# Altium schematic sheet POWERSWITCH.SchDoc
size A; SheetNumber: 4; SheetTotal: 4
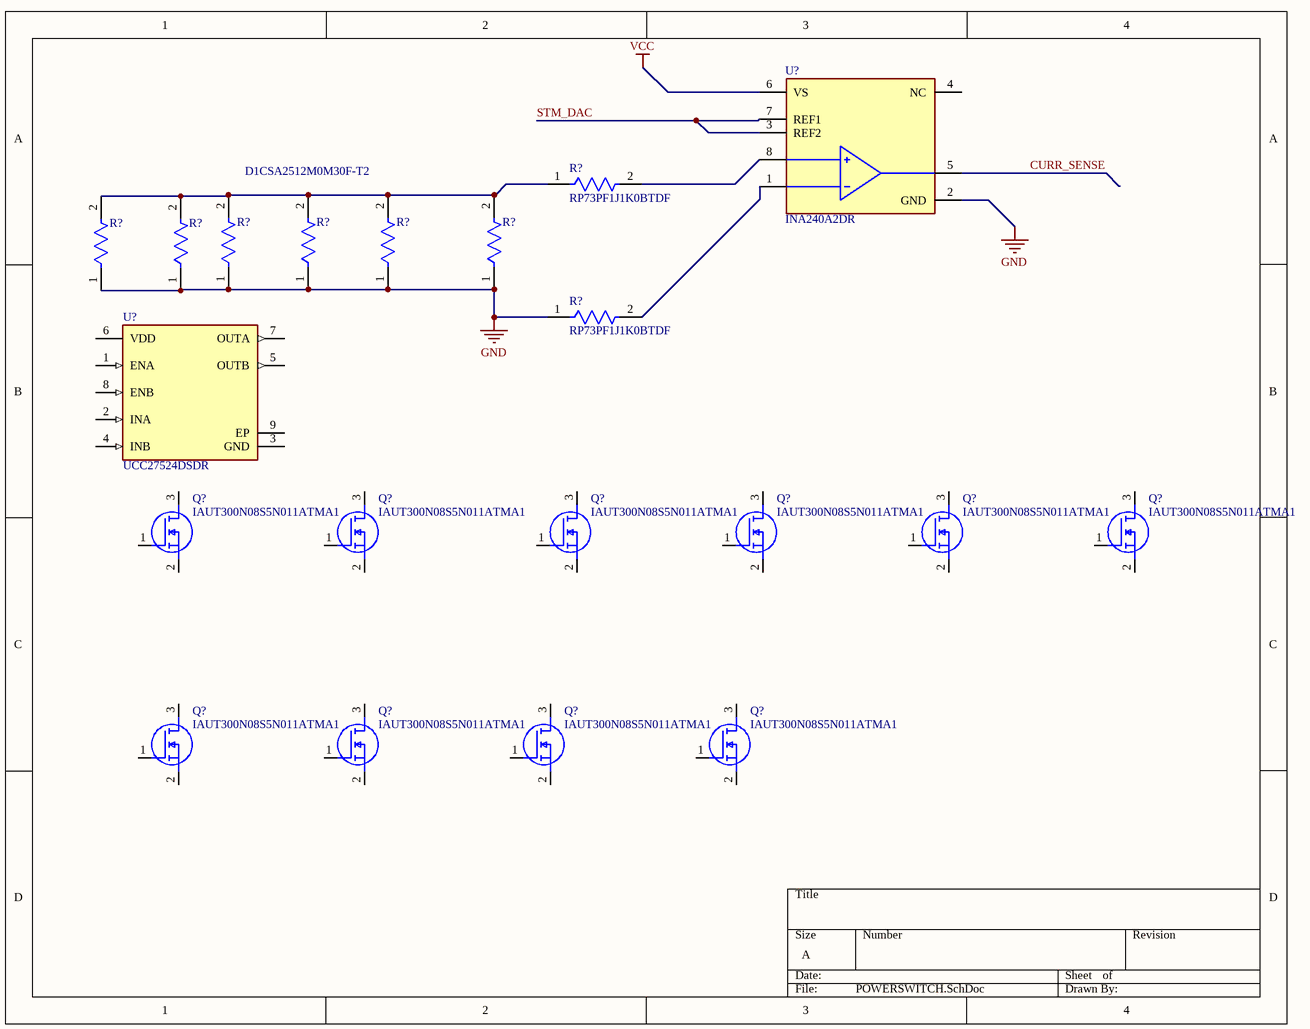
[diagram p0: POWERSWITCH.SchDoc]

## Parts
(Parts that share a designator on the sheet are numbered #1, #2 ... from top to bottom, then left to right.)
Q?#1  IAUT300N08S5N011ATMA1  [IAUT300N08S5N011ATMA1]
Q?#2  IAUT300N08S5N011ATMA1  [IAUT300N08S5N011ATMA1]
Q?#3  IAUT300N08S5N011ATMA1  [IAUT300N08S5N011ATMA1]
Q?#4  IAUT300N08S5N011ATMA1  [IAUT300N08S5N011ATMA1]
Q?#5  IAUT300N08S5N011ATMA1  [IAUT300N08S5N011ATMA1]
Q?#6  IAUT300N08S5N011ATMA1  [IAUT300N08S5N011ATMA1]
Q?#7  IAUT300N08S5N011ATMA1  [IAUT300N08S5N011ATMA1]
Q?#8  IAUT300N08S5N011ATMA1  [IAUT300N08S5N011ATMA1]
Q?#9  IAUT300N08S5N011ATMA1  [IAUT300N08S5N011ATMA1]
Q?#10  IAUT300N08S5N011ATMA1  [IAUT300N08S5N011ATMA1]
R?#1  RP73PF1J1K0BTDF  [FP-RP73P-1J-MFG]
R?#2  PU2512FKGP60U5L  [FP-PU2512-0U5-MFG]  (value not drawn)
R?#3  PU2512FKGP60U5L  [FP-PU2512-0U5-MFG]  (value not drawn)
R?#4  PU2512FKGP60U5L  [FP-PU2512-0U5-MFG]  (value not drawn)
R?#5  PU2512FKGP60U5L  [FP-PU2512-0U5-MFG]  (value not drawn)
R?#6  PU2512FKGP60U5L  [FP-PU2512-0U5-MFG]  (value not drawn)
R?#7  PU2512FKGP60U5L  [FP-PU2512-0U5-MFG]  (value not drawn)
R?#8  RP73PF1J1K0BTDF  [FP-RP73P-1J-MFG]
U?#1  INA240A2DR  [FP-D0008A-IPC_C]
U?#2  UCC27524DSDR  [FP-DSD0008D-IPC_B]

## Nets
GND: R?#2.1 R?#3.1 R?#4.1 R?#5.1 R?#6.1 R?#7.1 R?#8.1 U?#1.2(GND)
VCC: U?#1.6(VS)
CURR_SENSE: U?#1.5(OUT)
STM_DAC: U?#1.3(REF2) U?#1.7(REF1)
NetR?#1_1: R?#1.1 R?#2.2 R?#3.2 R?#4.2 R?#5.2 R?#6.2 R?#7.2
NetR?#1_2: R?#1.2 U?#1.8(IN+)
NetR?#8_2: R?#8.2 U?#1.1(IN-)

Not connected (* = marked no-connect by the designer): Q?#1 1(G) 2(S) 3(D); Q?#2 1(G) 2(S) 3(D); Q?#3 1(G) 2(S) 3(D); Q?#4 1(G) 2(S) 3(D); Q?#5 1(G) 2(S) 3(D); Q?#6 1(G) 2(S) 3(D); Q?#7 1(G) 2(S) 3(D); Q?#8 1(G) 2(S) 3(D); Q?#9 1(G) 2(S) 3(D); Q?#10 1(G) 2(S) 3(D); U?#1 4(NC); U?#2 1(ENA) 2(INA) 3(GND) 4(INB) 5(OUTB) 6(VDD) 7(OUTA) 8(ENB) 9(EP)

## Notes on the sheet
- (near R?#5) D1CSA2512M0M30F-T2

## Library data of the parts
Q?#1-Q?#10 = IAUT300N08S5N011ATMA1: MOSFET (N-Channel); Manufacturer_Name: Infineon; Datasheet Link: https://www.infineon.com/dgdl/Infineon-IAUT300N08S5N011-DataSheet-v01_02-EN.pdf?fileId=5546d46277921c32017795d395544683; Height: 2.3mm; Manufacturer_Part_Number: IAUT300N08S5N011ATMA1; Mouser Part Number: 726-IAUT300N08S5N011; Mouser Price/Stock: https://www.mouser.co.uk/ProductDetail/Infineon-Technologies/IAUT300N08S5N011ATMA1?qs=iLbezkQI%252Bsikk69sto2p9g%3D%3D; Arrow Part Number: IAUT300N08S5N011ATMA1; Arrow Price/Stock: https://www.arrow.com/en/products/iaut300n08s5n011atma1/infineon-technologies-ag?region=nac
R?#1 R?#8 = CMP-03211-004517-1: RES SMD 1K OHM 0.1% 1/6W 0603; Manufacturer: TE Connectivity; Value: 1KΩ; Power Rating: 0.166W; Tolerance: 0.001; Temperature Coefficient: 25ppm/°C; Voltage Rating: 100V; Composition: Thin Film; Category: Res; Temperature Range High: +155°C; Device Class L1: Passive Components; Digikey Description: RES SMD 1K OHM 0.1% 1/6W 0603; Lead Free: Yes; RoHS: TRUE; Ipc Land Pattern Name: RESC15580X45; Automotive: No; Temperature: -55°C to +155°C; Height: 0.55mm; ComponentLink2URL: https://www.te.com/commerce/DocumentDelivery/DDEController?Action=srchrtrv&DocNm=1773272&DocType=DS&DocLang=English; Manufacturer Part Number: RP73PF1J1K0BTDF; Resistance: 1KΩ; ComponentLink2Description: Datasheet; Temperature Range Low: -55°C; Octopart: https://octopart.com/rp73pf1j1k0btdf-te+connectivity-45465729; Device Class L3: Chip SMD Resistors; Series: RP73P; Package: RP73P-1J; Device Class L2: Resistors
R?#2-R?#7 = CMP-03412-008522-1: METAL SHUNT RESISTOR 2512 1% 200; Manufacturer: Yageo; Temperature Coefficient: 200ppm/°C; Automotive Grade: Grade 0; Power Rating: 6W; Resistance: 0.5mΩ; Value: 0.5mΩ; Digikey Description: METAL SHUNT RESISTOR 2512 1% 200; Temperature: -65°C to +170°C; Height: 1.47mm; Automotive: Yes; ComponentLink2Description: Datasheet; Tolerance: 1%; Package: PU2512-0U5; RoHS: TRUE; Category: Res; Device Class L3: Chip SMD Resistors; Manufacturer Part Number: PU2512FKGP60U5L; Device Class L1: Passive Components; Device Class L2: Resistors; Temperature Range Low: -65°C; Composition: Metal Element; Series: PU; Octopart: https://octopart.com/pu2512fkgp60u5l-yageo-89174057; Lead Free: Yes; Ipc Land Pattern Name: RESC635318X119; Temperature Range High: +170°C; ComponentLink2URL: http://www.yageo.com/documents/recent/PYu-PU_51_RoHS_L_6.pdf
U?#1 = CMP-04895-000405-1: IC CURR SENSE 1 CIRCUIT 8SOIC; Operating Supply Current: 1.8mA; Input Offset Voltage (Vos): 5uV; Input Bias Current: 90uA; Number of Circuits: 1; -3db Bandwidth: 400kHz; Slew Rate: 2V/µs; RoHS Compliant: Yes; Mount: Surface Mount; Case/Package: SOIC; Max Operating Temperature: 125°C; Min Operating Temperature: -40°C; Number of Pins: 8; Packaging: Tape and Reel
U?#2 = CMP-04912-000095-1: IC GATE DVR LO-SIDE DL 5A 8SON; Number of Channels: 2; Operating Supply Voltage: 12V; Propagation Delay: 23ns; Max Supply Voltage: 18V; Channel Type: Independent; Fall Time: 10ns; Rise Time: 18ns; Min Supply Voltage: 4.5V; Max Operating Temperature: 140°C; Min Operating Temperature: -40°C; Radiation Hardening: No; Package Quantity: 3000; Mount: Surface Mount; Number of Drivers: 2; Packaging: Tape and Reel; Max Output Current: 5A; Output Current: 5A; Case/Package: SON; Number of Pins: 8; Turn-On Delay Time: 23ns; Series: -; Lead Free: Lead Free; RoHS Compliant: Yes; Number of Outputs: 2